# Altium schematic sheet 09_J3_CONN.SchDoc
size 420 x 297 mm; SheetNumber: 9; SheetTotal: 9
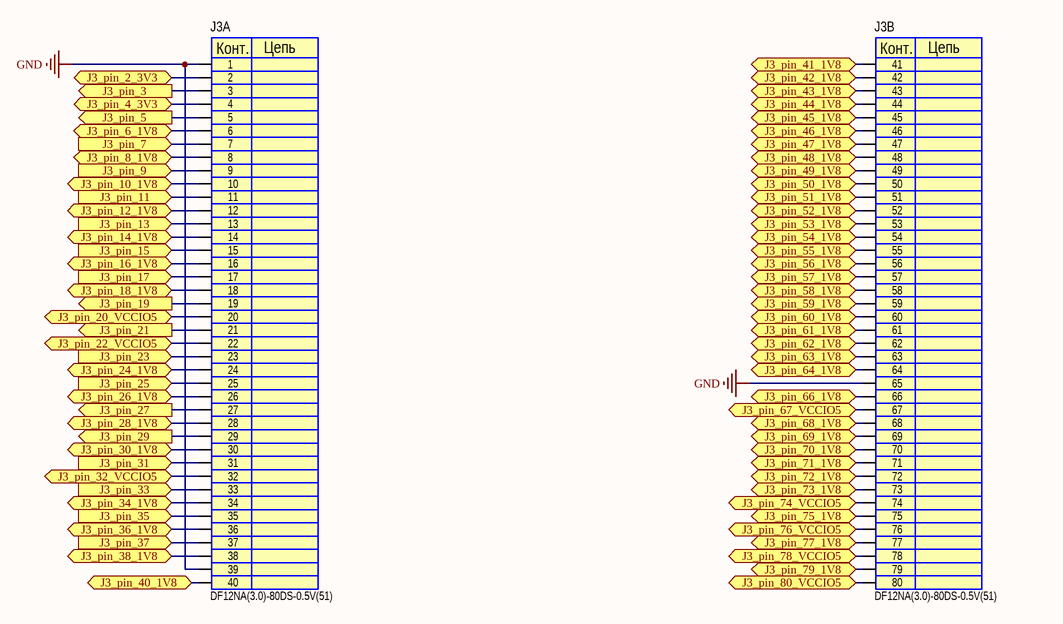
[diagram p0: 09_J3_CONN.SchDoc]

## Parts
J3  DF12NA(3.0)-80DS-0.5V(51)  [CONN_DF12NA3.0-80DS-0.5V51_HIR]  (parts A,B of 2)

## Ports
J3_pin_2_3V3 (bidir), J3_pin_3 (out), J3_pin_4_3V3 (bidir), J3_pin_5 (out), J3_pin_6_1V8 (bidir), J3_pin_7 (in), J3_pin_8_1V8 (bidir), J3_pin_9 (in), J3_pin_10_1V8 (bidir), J3_pin_11 (in), J3_pin_12_1V8 (bidir), J3_pin_13 (in), J3_pin_14_1V8 (bidir), J3_pin_15 (in), J3_pin_16_1V8 (bidir), J3_pin_17 (in), J3_pin_18_1V8 (bidir), J3_pin_19 (out), J3_pin_20_VCCIO5 (bidir), J3_pin_21 (out), J3_pin_22_VCCIO5 (bidir), J3_pin_23 (in), J3_pin_24_1V8 (bidir), J3_pin_25 (in), J3_pin_26_1V8 (bidir), J3_pin_27 (out), J3_pin_28_1V8 (bidir), J3_pin_29 (out), J3_pin_30_1V8 (bidir), J3_pin_31 (in), J3_pin_32_VCCIO5 (bidir), J3_pin_33 (in), J3_pin_34_1V8 (bidir), J3_pin_35 (in), J3_pin_36_1V8 (bidir), J3_pin_37 (in), J3_pin_38_1V8 (bidir), J3_pin_40_1V8 (bidir), J3_pin_41_1V8 (bidir), J3_pin_42_1V8 (bidir), J3_pin_43_1V8 (bidir), J3_pin_44_1V8 (bidir), J3_pin_45_1V8 (bidir), J3_pin_46_1V8 (bidir), J3_pin_47_1V8 (bidir), J3_pin_48_1V8 (bidir), J3_pin_49_1V8 (bidir), J3_pin_50_1V8 (bidir), J3_pin_51_1V8 (bidir), J3_pin_52_1V8 (bidir), J3_pin_53_1V8 (bidir), J3_pin_54_1V8 (bidir), J3_pin_55_1V8 (bidir), J3_pin_56_1V8 (bidir), J3_pin_57_1V8 (bidir), J3_pin_58_1V8 (bidir), J3_pin_59_1V8 (bidir), J3_pin_60_1V8 (bidir), J3_pin_61_1V8 (bidir), J3_pin_62_1V8 (bidir), J3_pin_63_1V8 (bidir), J3_pin_64_1V8 (bidir), J3_pin_66_1V8 (bidir), J3_pin_67_VCCIO5 (bidir), J3_pin_68_1V8 (bidir), J3_pin_69_1V8 (bidir), J3_pin_70_1V8 (bidir), J3_pin_71_1V8 (bidir), J3_pin_72_1V8 (bidir), J3_pin_73_1V8 (bidir), J3_pin_74_VCCIO5 (bidir), J3_pin_75_1V8 (bidir), J3_pin_76_VCCIO5 (bidir), J3_pin_77_1V8 (bidir), J3_pin_78_VCCIO5 (bidir), J3_pin_79_1V8 (bidir), J3_pin_80_VCCIO5 (bidir)

## Nets
GND: J3.1 J3.39 J3.65
J3_pin_2_3V3: J3.2 ; port J3_pin_2_3V3
J3_pin_3: J3.3 ; port J3_pin_3
J3_pin_4_3V3: J3.4 ; port J3_pin_4_3V3
J3_pin_5: J3.5 ; port J3_pin_5
J3_pin_6_1V8: J3.6 ; port J3_pin_6_1V8
J3_pin_7: J3.7 ; port J3_pin_7
J3_pin_8_1V8: J3.8 ; port J3_pin_8_1V8
J3_pin_9: J3.9 ; port J3_pin_9
J3_pin_10_1V8: J3.10 ; port J3_pin_10_1V8
J3_pin_11: J3.11 ; port J3_pin_11
J3_pin_12_1V8: J3.12 ; port J3_pin_12_1V8
J3_pin_13: J3.13 ; port J3_pin_13
J3_pin_14_1V8: J3.14 ; port J3_pin_14_1V8
J3_pin_15: J3.15 ; port J3_pin_15
J3_pin_16_1V8: J3.16 ; port J3_pin_16_1V8
J3_pin_17: J3.17 ; port J3_pin_17
J3_pin_18_1V8: J3.18 ; port J3_pin_18_1V8
J3_pin_19: J3.19 ; port J3_pin_19
J3_pin_20_VCCIO5: J3.20 ; port J3_pin_20_VCCIO5
J3_pin_21: J3.21 ; port J3_pin_21
J3_pin_22_VCCIO5: J3.22 ; port J3_pin_22_VCCIO5
J3_pin_23: J3.23 ; port J3_pin_23
J3_pin_24_1V8: J3.24 ; port J3_pin_24_1V8
J3_pin_25: J3.25 ; port J3_pin_25
J3_pin_26_1V8: J3.26 ; port J3_pin_26_1V8
J3_pin_27: J3.27 ; port J3_pin_27
J3_pin_28_1V8: J3.28 ; port J3_pin_28_1V8
J3_pin_29: J3.29 ; port J3_pin_29
J3_pin_30_1V8: J3.30 ; port J3_pin_30_1V8
J3_pin_31: J3.31 ; port J3_pin_31
J3_pin_32_VCCIO5: J3.32 ; port J3_pin_32_VCCIO5
J3_pin_33: J3.33 ; port J3_pin_33
J3_pin_34_1V8: J3.34 ; port J3_pin_34_1V8
J3_pin_35: J3.35 ; port J3_pin_35
J3_pin_36_1V8: J3.36 ; port J3_pin_36_1V8
J3_pin_37: J3.37 ; port J3_pin_37
J3_pin_38_1V8: J3.38 ; port J3_pin_38_1V8
J3_pin_40_1V8: J3.40 ; port J3_pin_40_1V8
J3_pin_41_1V8: J3.41 ; port J3_pin_41_1V8
J3_pin_42_1V8: J3.42 ; port J3_pin_42_1V8
J3_pin_43_1V8: J3.43 ; port J3_pin_43_1V8
J3_pin_44_1V8: J3.44 ; port J3_pin_44_1V8
J3_pin_45_1V8: J3.45 ; port J3_pin_45_1V8
J3_pin_46_1V8: J3.46 ; port J3_pin_46_1V8
J3_pin_47_1V8: J3.47 ; port J3_pin_47_1V8
J3_pin_48_1V8: J3.48 ; port J3_pin_48_1V8
J3_pin_49_1V8: J3.49 ; port J3_pin_49_1V8
J3_pin_50_1V8: J3.50 ; port J3_pin_50_1V8
J3_pin_51_1V8: J3.51 ; port J3_pin_51_1V8
J3_pin_52_1V8: J3.52 ; port J3_pin_52_1V8
J3_pin_53_1V8: J3.53 ; port J3_pin_53_1V8
J3_pin_54_1V8: J3.54 ; port J3_pin_54_1V8
J3_pin_55_1V8: J3.55 ; port J3_pin_55_1V8
J3_pin_56_1V8: J3.56 ; port J3_pin_56_1V8
J3_pin_57_1V8: J3.57 ; port J3_pin_57_1V8
J3_pin_58_1V8: J3.58 ; port J3_pin_58_1V8
J3_pin_59_1V8: J3.59 ; port J3_pin_59_1V8
J3_pin_60_1V8: J3.60 ; port J3_pin_60_1V8
J3_pin_61_1V8: J3.61 ; port J3_pin_61_1V8
J3_pin_62_1V8: J3.62 ; port J3_pin_62_1V8
J3_pin_63_1V8: J3.63 ; port J3_pin_63_1V8
J3_pin_64_1V8: J3.64 ; port J3_pin_64_1V8
J3_pin_66_1V8: J3.66 ; port J3_pin_66_1V8
J3_pin_67_VCCIO5: J3.67 ; port J3_pin_67_VCCIO5
J3_pin_68_1V8: J3.68 ; port J3_pin_68_1V8
J3_pin_69_1V8: J3.69 ; port J3_pin_69_1V8
J3_pin_70_1V8: J3.70 ; port J3_pin_70_1V8
J3_pin_71_1V8: J3.71 ; port J3_pin_71_1V8
J3_pin_72_1V8: J3.72 ; port J3_pin_72_1V8
J3_pin_73_1V8: J3.73 ; port J3_pin_73_1V8
J3_pin_74_VCCIO5: J3.74 ; port J3_pin_74_VCCIO5
J3_pin_75_1V8: J3.75 ; port J3_pin_75_1V8
J3_pin_76_VCCIO5: J3.76 ; port J3_pin_76_VCCIO5
J3_pin_77_1V8: J3.77 ; port J3_pin_77_1V8
J3_pin_78_VCCIO5: J3.78 ; port J3_pin_78_VCCIO5
J3_pin_79_1V8: J3.79 ; port J3_pin_79_1V8
J3_pin_80_VCCIO5: J3.80 ; port J3_pin_80_VCCIO5

## Notes on the sheet
- THIS DOCUMENT AND THE DATA DISCLOSED HEREIN OR
- HEREWITH IS THE PROPERTY OF ALTIUM LIMITED AND MAY
- DWG NO:
- REVISION
- REV:
- DESCRIPTION
- DATE
- APPROVED
- BE FREELY DISTRIBUTED IN WHOLE. NO RIGHTS ARE
- RESERVED OR EXPRESS OR IMPLIED WARANTEE GIVEN.
- ENG:
- APPROVALS
- PROJECT
- DSN:
- CHK:
- REFERENCE DOCUMENTS
- PROJECT REVISION:
- TITLE
- DOCUMENT REVISION:
- DESIGN ITEM:
- BOM:
- FAB DWG:
- PCB DWG:
- ASSY DWG:
- SCALE:
- A3
- SIZE
- CAGE CODE
- FILE NAME
- DWG NO.
- SHEET
- OF
- REV
- (in symbol DF12NA(3.0)-80DS-0.5V(51), part A) Конт.; Цепь
- (in symbol DF12NA(3.0)-80DS-0.5V(51), part B) Конт.; Цепь

## Library data of the parts
J3 = DF12NA(3.0)-80DS-0.5V(51): 0.5mm Pitch SMT Board-to-Board Connector; Manufacturer: Hirose; Row: 2; Positions: 80; Male/Female: F; ComponentLink1Description: Link; ComponentLink2Description: LocalLink; ComponentLink2URL: C:\Users\Public\Documents\Altium\Datasheet\Connectors\DF12NA(3.0)-80DS-0.5V(51).pdf; Type: Board-to-Board; Temperature: -40...+105°C; PartNumber: DF12NA(3.0)-80DS-0.5V(51)